# Altium schematic sheet FanARGB_Channel.SchDoc
size A3; SheetNumber: 2; SheetTotal: 2
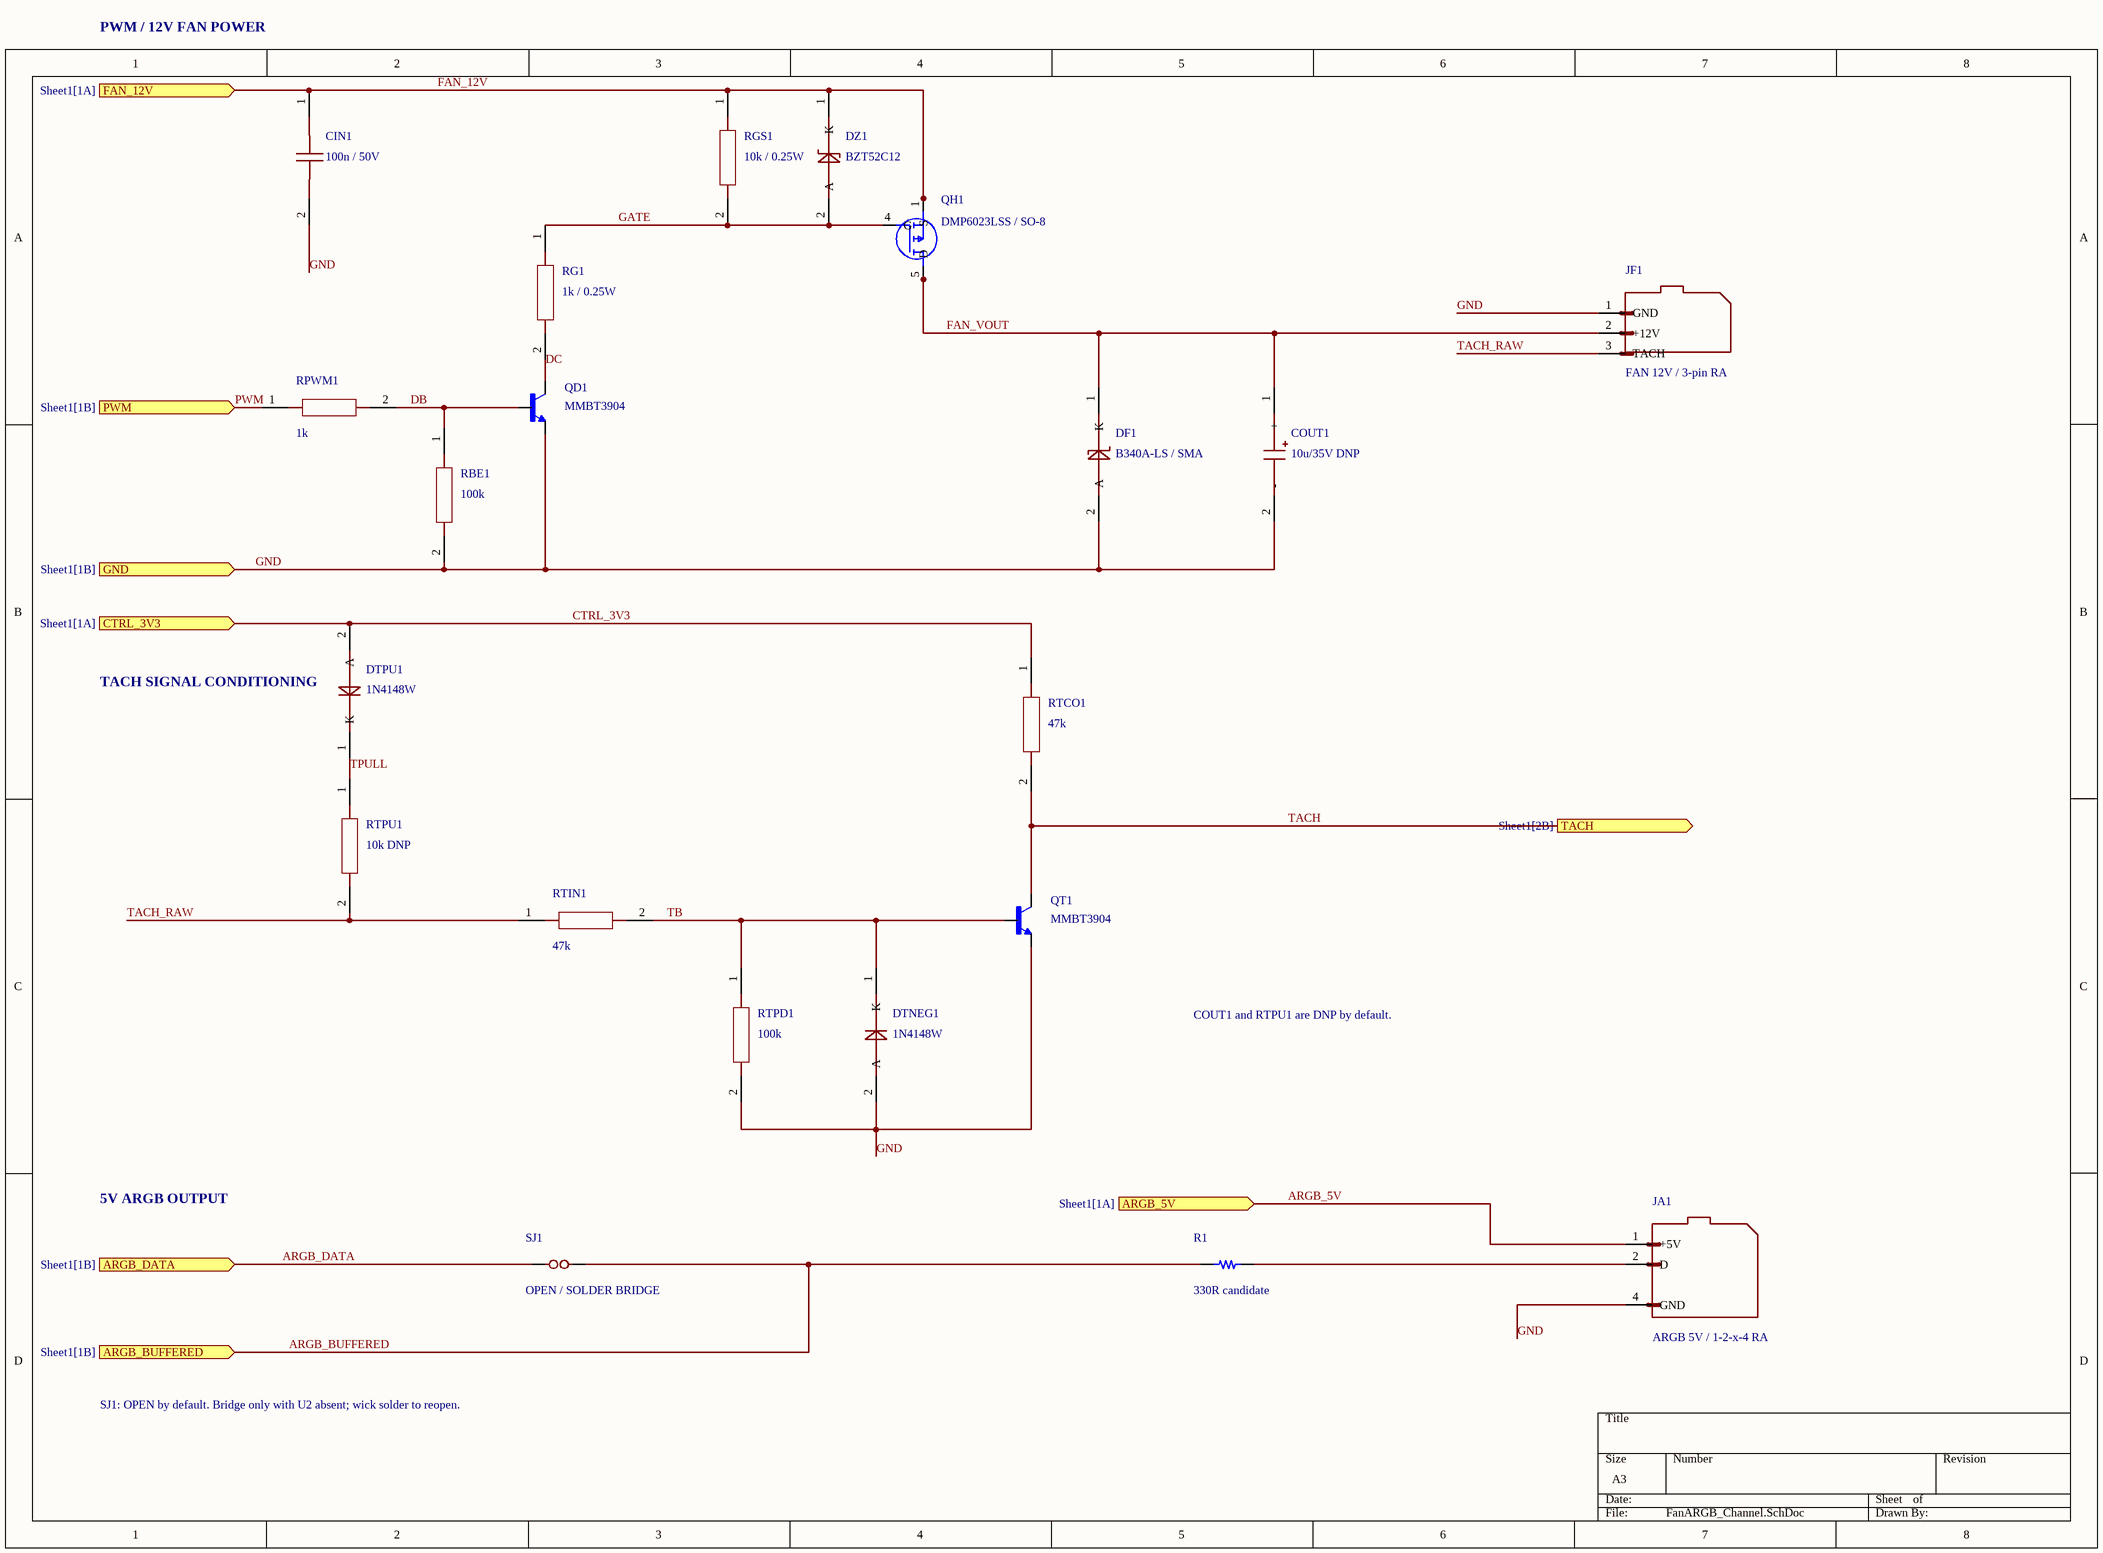
[diagram p0: FanARGB_Channel.SchDoc]

## Parts
CIN1  100n / 50V  [CH0603C]
COUT1  10u/35V DNP  [EEE_FK_5x5_8]
DF1  B340A-LS / SMA  [B340ALS_DIODES_SMA]
DTNEG1  1N4148W  [D_SOD123_DIODESINC]
DTPU1  1N4148W  [D_SOD123_DIODESINC]
DZ1  BZT52C12  [D_SOD123_DIODESINC]
JA1  ARGB 5V / 1-2-x-4 RA  [TSW_104_08_S_RA_003_ARGB]
JF1  FAN 12V / 3-pin RA  [Molex_22053031_RA]
QD1  MMBT3904  [MMBT3904_SOT23]
QH1  DMP6023LSS / SO-8  [DMP6023LSS_SO8]
QT1  MMBT3904  [MMBT3904_SOT23]
R1  330R candidate  [CH0603R]
RBE1  100k  [CH0603R]
RG1  1k / 0.25W  [CH1206R]
RGS1  10k / 0.25W  [CH1206R]
RPWM1  1k  [CH0603R]
RTCO1  47k  [CH0603R]
RTIN1  47k  [CH0603R]
RTPD1  100k  [CH0603R]
RTPU1  10k DNP  [CH0603R]
SJ1  OPEN / SOLDER BRIDGE  [SJ_RECT_125X095_G030]  (no BOM)

## Ports
ARGB_5V (in, see Sheet1[1A]), ARGB_BUFFERED (in, see Sheet1[1B]), ARGB_DATA (in, see Sheet1[1B]), CTRL_3V3 (in, see Sheet1[1A]), FAN_12V (in, see Sheet1[1A]), GND (in, see Sheet1[1B]), PWM (in, see Sheet1[1B]), TACH (out, see Sheet1[2B])

## Nets
ARGB_5V: JA1.1(+5V) ; port ARGB_5V
ARGB_BUFFERED: R1.1 SJ1.2 ; port ARGB_BUFFERED
ARGB_DATA: SJ1.1 ; port ARGB_DATA
CTRL_3V3: DTPU1.2(A) RTCO1.1 ; port CTRL_3V3
DB: QD1.1(B) RBE1.1 RPWM1.2
DC: QD1.3(C) RG1.2
FAN_12V: CIN1.1 DZ1.1(K) QH1.1(S) QH1.2(S) QH1.3(S) RGS1.1 ; port FAN_12V
FAN_VOUT: COUT1.1(+) DF1.1(K) JF1.2(+12V) QH1.5(D) QH1.6(D) QH1.7(D) QH1.8(D)
GATE: DZ1.2(A) QH1.4(G) RG1.1 RGS1.2
GND: CIN1.2 COUT1.2(-) DF1.2(A) DTNEG1.2(A) JA1.4(GND) JF1.1(GND) QD1.2(E) QT1.2(E) RBE1.2 RTPD1.2 ; port GND
PWM: RPWM1.1 ; port PWM
TACH: QT1.3(C) RTCO1.2 ; port TACH
TACH_RAW: JF1.3(TACH) RTIN1.1 RTPU1.2
TB: DTNEG1.1(K) QT1.1(B) RTIN1.2 RTPD1.1
TPULL: DTPU1.1(K) RTPU1.1
NetJA1_2: JA1.2(D) R1.2

## Notes on the sheet
- PWM / 12V FAN POWER
- TACH SIGNAL CONDITIONING
- COUT1 and RTPU1 are DNP by default.
- 5V ARGB OUTPUT
- SJ1: OPEN by default. Bridge only with U2 absent; wick solder to reopen.

## Library data of the parts
CIN1 = AUTHORED_C: AUTHORED native symbol; verified electrical pin IDs per tools/PWM_TOPOLOGY.md; no approved footprint; Provenance: AUTHORED; datasheet pin identity in tools/PWM_TOPOLOGY.md
COUT1 = AUTHORED_POLAR_C: Aluminum electrolytic capacitor, 10uF 35V, 5x5.8 mm, DNP; Manufacturer: Panasonic; Manufacturer Part Number: EEE-FK1V100R; Provenance: AUTHORED; datasheet pin identity in tools/PWM_TOPOLOGY.md; DefaultPopulation: DNP; Package: SMD electrolytic dia 5 mm; Datasheet: https://industrial.panasonic.com/ww/products/pt/aluminum-cap-smd/models/EEEFK1V100R
DF1 = AUTHORED_SCHOTTKY: B340A-LS Schottky rectifier 40 V 3 A SMA, pin 1 cathode; Manufacturer: Diodes Incorporated; Provenance: AUTHORED; datasheet pin identity in tools/PWM_TOPOLOGY.md; Manufacturer Part Number: B340A-LS; Package: SMA / DO-214AC; Datasheet: https://www.diodes.com/datasheet/download/B340A%28LS%29.pdf
DTNEG1 DTPU1 = AUTHORED_DIODE: Small-signal switching diode, SOD-123, cathode pad 1; Manufacturer: Diodes Incorporated; Manufacturer Part Number: 1N4148W-7-F; Provenance: AUTHORED; datasheet pin identity in tools/PWM_TOPOLOGY.md; Package: SOD-123; Datasheet: https://www.diodes.com/datasheet/download/1N4148W.pdf
DZ1 = AUTHORED_ZENER: 12V Zener diode, SOD-123, cathode pad 1; Manufacturer: Diodes Incorporated; Manufacturer Part Number: BZT52C12-7-F; Provenance: AUTHORED; datasheet pin identity in tools/PWM_TOPOLOGY.md; Package: SOD-123; Datasheet: https://www.diodes.com/datasheet/download/BZT52Cxx.pdf
JA1 = CUSTOM_ARGB_KEYED: Samtec TSW-104-08-L-S-RA-003, right-angle 5V ARGB header with pin 3 omitted; Manufacturer: Samtec; Manufacturer Part Number: TSW-104-08-L-S-RA-003; Package: THT right-angle, 2.54 mm, position 3 omitted; Datasheet: https://suddendocs.samtec.com/prints/tsw-xxx-xx-xxx-x-xx-xxx-mkt.pdf
JF1 = CUSTOM_FAN_3PIN: Molex KK 254 Series 7478 friction-lock right-angle fan header, three through-hole pins; Manufacturer: Molex; Manufacturer Part Number: 22-05-3031; Package: KK 254, right angle, THT; Datasheet: https://www.molex.com/en-us/products/part-detail/0022053031
QD1 QT1 = MMBT3904LT1G: NPN BJT 40V 200mA, SOT-23, B1 E2 C3; Manufacturer: onsemi; Value: *; Manufacturer Part Number: MMBT3904LT1G; Package: SOT-23; Datasheet: https://www.onsemi.com/pdf/datasheet/mmbt3904lt1-d.pdf
QH1 = DMP6023LSS-13: P-channel MOSFET -60 V, 25 mOhm at -10 V, in SO-8; S1-3 G4 D5-8; Manufacturer: Diodes Incorporated; Manufacturer Part Number: DMP6023LSS-13; Package: SO-8; Datasheet: https://www.diodes.com/datasheet/download/DMP6023LSS.pdf
R1 = Resistor: SMT Resistor
RBE1 RPWM1 RTCO1 RTIN1 RTPD1 = AUTHORED_R: AUTHORED native symbol; verified electrical pin IDs per tools/PWM_TOPOLOGY.md; no approved footprint; Provenance: AUTHORED; datasheet pin identity in tools/PWM_TOPOLOGY.md
RG1 = AUTHORED_R: 1k 1% 0.25W at 70C, 1206 resistor; Manufacturer: Yageo; Manufacturer Part Number: RC1206FR-071KL; Provenance: AUTHORED; datasheet pin identity in tools/PWM_TOPOLOGY.md; Package: 1206; Datasheet: https://yageogroup.com/component-documentation/download/specsheet/RC1206FR-071KL
RGS1 = AUTHORED_R: 10k 1% 0.25W at 70C, 1206 resistor; Manufacturer: Yageo; Manufacturer Part Number: RC1206FR-0710KL; Provenance: AUTHORED; datasheet pin identity in tools/PWM_TOPOLOGY.md; Package: 1206; Datasheet: https://yageogroup.com/component-documentation/download/specsheet/RC1206FR-0710KL
RTPU1 = AUTHORED_R: AUTHORED native symbol; verified electrical pin IDs per tools/PWM_TOPOLOGY.md; no approved footprint; Provenance: AUTHORED; datasheet pin identity in tools/PWM_TOPOLOGY.md; DefaultPopulation: DNP
SJ1 = SolderJumper_Open_2: Normally open solder pads. Bridge only when U2 is not installed. Remove solder to open.; DefaultPopulation: OPEN - PCB pads only; AssemblyOption: BUFFERED: leave open; DIRECT: U2 absent, hand-bridge pads; Value: OPEN